# Altium schematic sheet Top_Sheet.SchDoc
size A4; SheetNumber: 1; SheetTotal: 4
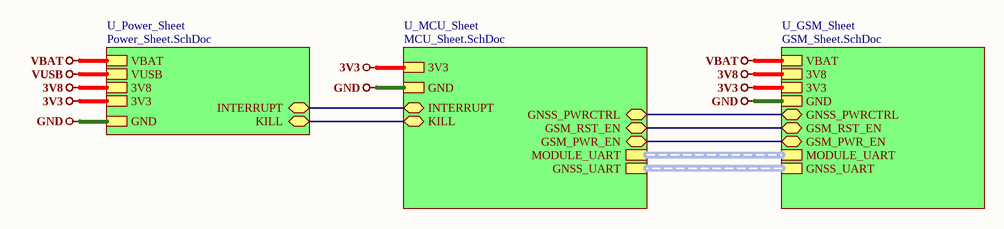
[diagram p0: Top_Sheet.SchDoc]

## Sub-sheets
U_GSM_Sheet = GSM_Sheet.SchDoc: GSM_PWR_EN (bidir), GSM_RST_EN (bidir), MODULE_UART (harness MODULE_UART), GND, 3V8, VBAT, 3V3, GNSS_UART (harness GNSS_UART), GNSS_PWRCTRL (bidir)
U_MCU_Sheet = MCU_Sheet.SchDoc: MODULE_UART (harness MODULE_UART), GNSS_UART (harness GNSS_UART), GSM_PWR_EN (bidir), GSM_RST_EN (bidir), GNSS_PWRCTRL (bidir), GND, 3V3, INTERRUPT (bidir), KILL (bidir)
U_Power_Sheet = Power_Sheet.SchDoc: GND, 3V8, VUSB, VBAT, 3V3, INTERRUPT (bidir), KILL (bidir)

## Nets
3V3: sheet U_GSM_Sheet/3V3, sheet U_Power_Sheet/3V3, sheet U_MCU_Sheet/3V3
3V8: sheet U_GSM_Sheet/3V8, sheet U_Power_Sheet/3V8
GND: sheet U_GSM_Sheet/GND, sheet U_Power_Sheet/GND, sheet U_MCU_Sheet/GND
VBAT: sheet U_GSM_Sheet/VBAT, sheet U_Power_Sheet/VBAT
VUSB: sheet U_Power_Sheet/VUSB
(unnamed): sheet U_GSM_Sheet/GSM_PWR_EN, sheet U_MCU_Sheet/GSM_PWR_EN
(unnamed): sheet U_GSM_Sheet/GSM_RST_EN, sheet U_MCU_Sheet/GSM_RST_EN
(unnamed): sheet U_GSM_Sheet/GNSS_PWRCTRL, sheet U_MCU_Sheet/GNSS_PWRCTRL
(unnamed): sheet U_Power_Sheet/INTERRUPT, sheet U_MCU_Sheet/INTERRUPT
(unnamed): sheet U_Power_Sheet/KILL, sheet U_MCU_Sheet/KILL

## Buses and harness runs
harness sheet U_GSM_Sheet/GNSS_UART = sheet U_MCU_Sheet/GNSS_UART
harness sheet U_GSM_Sheet/MODULE_UART = sheet U_MCU_Sheet/MODULE_UART

## Notes on the sheet
- File:
- Title:
- Date:
- Page
- Num:
- Total:
- Drawn By: Huzaifa Ali